# Altium schematic sheet Wiring_connection_scheme_J2.SchDoc: =DT_SCH_Title
size A4; Organization: Droid Technologies; SheetNumber: 21; SheetTotal: 22
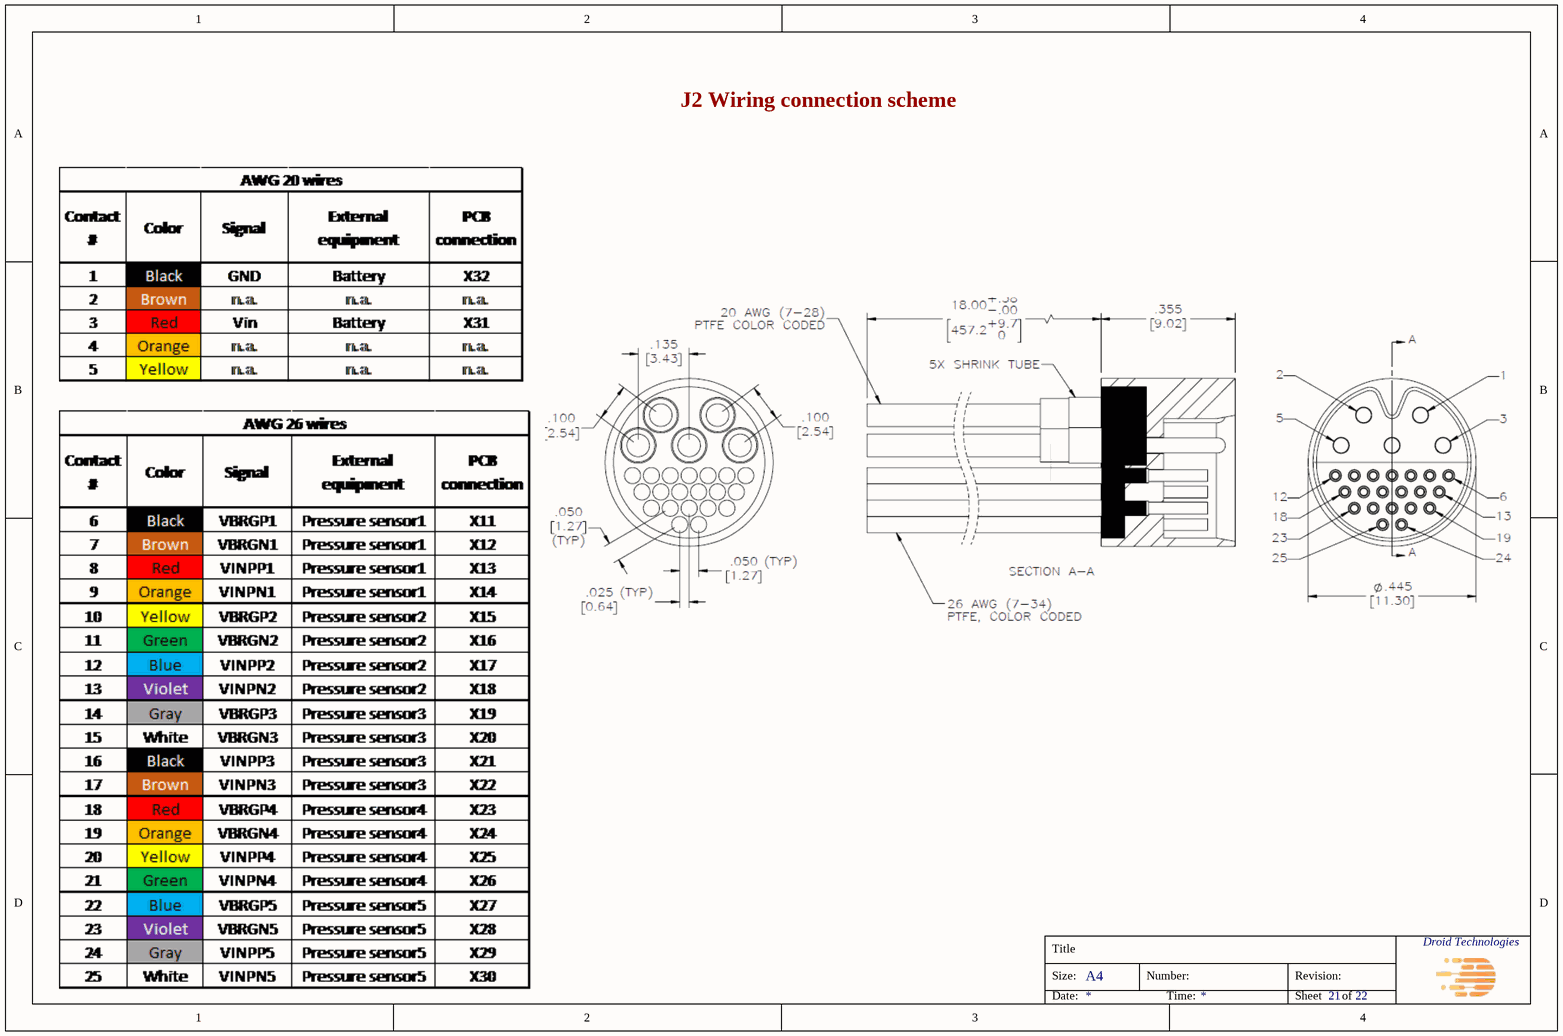
[diagram p0: Wiring_connection_scheme_J2.SchDoc]

## Notes on the sheet
- J2 Wiring connection scheme
- Title
- Size:
- A4
- Number:
- Revision:
- Date:
- Time:
- Sheet
- of